# Altium schematic sheet Sheet2.SchDoc: Smart Delivery Robot
size A; Date: 27/12/2023; DrawnBy: Abd El-Rhman m. Saad; Engineer: Abd El-Rhman m. Saad; SheetNumber: 2; SheetTotal: 2
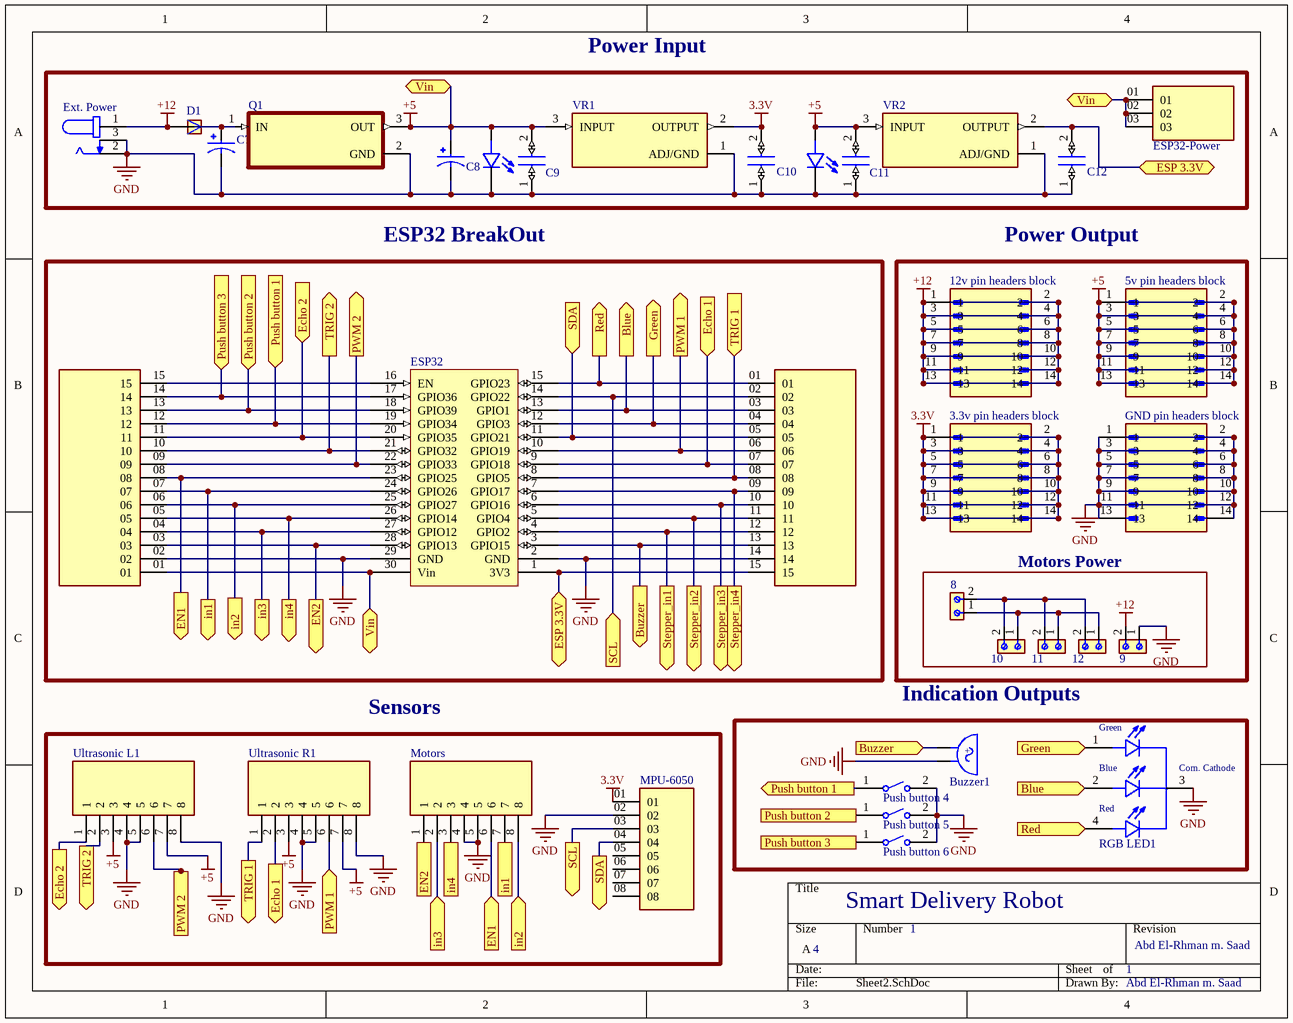
[diagram p0: Sheet2.SchDoc]

## Parts
1  LED 5mm  [LED 5mm]  (value not drawn)
2  LED 5mm  [LED 5mm]  (value not drawn)
3.3v_pin_headers_block  3.3v pin headers block  [AMPHENOL_52601-S14-4LF]  (value not drawn)
5v_pin_headers_block  5v pin headers block  [AMPHENOL_52601-S14-4LF]  (value not drawn)
8  From Buck  [691213510002]  (value not drawn)
9  From Buck  [691213510002]  (value not drawn)
10  From Buck  [691213510002]  (value not drawn)
11  From Buck  [691213510002]  (value not drawn)
12  From Buck  [691213510002]  (value not drawn)
12v_pin_headers_block  12v pin headers block  [AMPHENOL_52601-S14-4LF]  (value not drawn)
Buzzer1  Buzzer  [Buzzer 5V]  (value not drawn)
C7  CAP  33UF 50V RADIAL  [CAP  33UF 50V RADIAL]  (value not drawn)
C8  CAP  33UF 50V RADIAL  [CAP  33UF 50V RADIAL]  (value not drawn)
C9  Ceramic Capacitor 100nF  [C320C]  (value not drawn)
C10  Ceramic Capacitor 100nF  [C320C]  (value not drawn)
C11  Ceramic Capacitor 100nF  [C320C]  (value not drawn)
C12  Ceramic Capacitor 100nF  [C320C]  (value not drawn)
D1  RL207  [DIOAD1300W80L670D310]  (value not drawn)
ESP32  ESP32DEVKITV1  [ESP32DEVKITV1]  (value not drawn)
ESP32-Power  TS-103-T-A-1  [SAMTEC_TS-103-T-A-1]  (value not drawn)
Ext._Power  DC Power Jack Female Socket  [DC Power Jack Female Socket]  (value not drawn)
GND_pin_headers_block  GND pin headers block  [AMPHENOL_52601-S14-4LF]  (value not drawn)
J1  TS-115-T-A-1  [SAMTEC_TS-115-T-A-1]  (value not drawn)
J2  TS-115-T-A-1  [SAMTEC_TS-115-T-A-1]  (value not drawn)
Motors  Pin header female block 8 pin  [Pin header female block 8 pin]  (value not drawn)
MPU-6050  MPU-6050  [MPU-6050]  (value not drawn)
Push_button_4  FSM8JRT  [TE_FSM8JRT]  (value not drawn)
Push_button_5  FSM8JRT  [TE_FSM8JRT]  (value not drawn)
Push_button_6  FSM8JRT  [TE_FSM8JRT]  (value not drawn)
Q1  LM7805CT  [TO254P1054X470X1955-3]  (value not drawn)
RGB_LED1  common cathode  [LED RGB 5mm]  (value not drawn)
Ultrasonic_L1  Pin header female block 8 pin  [Pin header female block 8 pin]  (value not drawn)
Ultrasonic_R1  Pin header female block 8 pin  [Pin header female block 8 pin]  (value not drawn)
VR1  LM1117T-3.3  [TO254P1054X470X1955-3]  (value not drawn)
VR2  LM1117T-3.3  [TO254P1054X470X1955-3]  (value not drawn)

## Blocks framed on the sheet
Power Input: 1 2 C7-C12 D1 ESP32-Power Ext._Power Q1 VR1 VR2
ESP32 BreakOut: ESP32 J1 J2
Power Output: 3.3v_pin_headers_block 5v_pin_headers_block 12v_pin_headers_block GND_pin_headers_block
Motors Power: 8-12
Indication Outputs: Buzzer1 Push_button_4-Push_button_6 RGB_LED1
Sensors: Motors MPU-6050 Ultrasonic_L1 Ultrasonic_R1

## Ports
Blue (in, see Sheet1[2B], Sheet1[4B], Sheet2[2B]), Blue (out, see Sheet1[2B], Sheet1[4B], Sheet2[4D]), Buzzer (in, see Sheet1[2C], Sheet1[4A], Sheet2[2C]), Buzzer (out, see Sheet1[2C], Sheet1[4A], Sheet2[3C]), Echo 1 (in, see Sheet1[3B], Sheet1[4B], Sheet2[1D]), Echo 1 (out, see Sheet1[3B], Sheet1[4B], Sheet2[3B]), Echo 2 (in, see Sheet1[1B], Sheet1[3B], Sheet2[1D]), Echo 2 (out, see Sheet1[1B], Sheet1[3B], Sheet2[1B]), EN1 (in, see Sheet1[1C], Sheet1[4C], Sheet2[1C]), EN1 (out, see Sheet1[1C], Sheet1[4C], Sheet2[2D]), EN2 (in, see Sheet1[2C], Sheet1[4C], Sheet2[1C]), EN2 (out, see Sheet1[2C], Sheet1[4C], Sheet2[2D]), ESP 3.3V (bidir, see Sheet1[2C], Sheet1[3A], Sheet2[2C]), ESP 3.3V (bidir, see Sheet1[2C], Sheet1[3A], Sheet2[4A]), Green (in, see Sheet1[3B], Sheet1[4B], Sheet2[3B]), Green (out, see Sheet1[3B], Sheet1[4B], Sheet2[4C]), in1 (in, see Sheet1[1C], Sheet1[4C], Sheet2[1C]), in1 (out, see Sheet1[1C], Sheet1[4C], Sheet2[2D]), in2 (in, see Sheet1[1C], Sheet1[4C], Sheet2[1C]), in2 (out, see Sheet1[1C], Sheet1[4C], Sheet2[2D]), in3 (in, see Sheet1[1C], Sheet1[4C], Sheet2[1C]), in3 (out, see Sheet1[1C], Sheet1[4C], Sheet2[2D]), in4 (in, see Sheet1[1C], Sheet1[4C], Sheet2[1C]), in4 (out, see Sheet1[1C], Sheet1[4C], Sheet2[2D]), Push button 1 (in, see Sheet1[1B], Sheet1[4C], Sheet2[3D]), Push button 1 (out, see Sheet1[1B], Sheet1[4C], Sheet2[1B]), Push button 2 (in, see Sheet1[1B], Sheet1[4D], Sheet2[3D]), Push button 2 (out, see Sheet1[1B], Sheet1[4D], Sheet2[1B]), Push button 3 (in, see Sheet1[1B], Sheet1[4D], Sheet2[3D]), Push button 3 (out, see Sheet1[1B], Sheet1[4D], Sheet2[1B]), PWM 1 (in, see Sheet1[3B], Sheet1[4B], Sheet2[3B]), PWM 1 (out, see Sheet1[3B], Sheet1[4B], Sheet2[2D]), PWM 2 (in, see Sheet1[2B], Sheet1[4B], Sheet2[2B]), PWM 2 (out, see Sheet1[2B], Sheet1[4B], Sheet2[1D]), Red (in, see Sheet1[2B], Sheet1[4B], Sheet2[2B]), Red (out, see Sheet1[2B], Sheet1[4B], Sheet2[4D]), SCL (in, see Sheet1[2C], Sheet1[3C], Sheet2[2D]), SCL (out, see Sheet1[2C], Sheet1[3C], Sheet2[2C]), SDA (in, see Sheet1[2B], Sheet1[4C], Sheet2[2D]), SDA (out, see Sheet1[2B], Sheet1[4C], Sheet2[2B]), Stepper_in1 (out, see Sheet1[2C]), Stepper_in2 (out, see Sheet1[3C]), Stepper_in3 (out, see Sheet1[3C]), Stepper_in4 (out, see Sheet1[3C]), TRIG 1 (in, see Sheet1[3B], Sheet1[4B], Sheet2[1D]), TRIG 1 (out, see Sheet1[3B], Sheet1[4B], Sheet2[3B]), TRIG 2 (out, see Sheet1[1B], Sheet1[3B], Sheet2[1D]), TRIG 2 (out, see Sheet1[1B], Sheet1[3B], Sheet2[2B]), Vin (bidir, see Sheet1[2A], Sheet1[2C], Sheet2[2A], Sheet2[2C]), Vin (bidir, see Sheet1[2A], Sheet1[2C], Sheet2[2A], Sheet2[4A]), Vin (bidir, see Sheet1[2A], Sheet1[2C], Sheet2[2C], Sheet2[4A])

## Nets
3.3V: 3.3v_pin_headers_block.1 3.3v_pin_headers_block.2 3.3v_pin_headers_block.3 3.3v_pin_headers_block.4 3.3v_pin_headers_block.5 3.3v_pin_headers_block.6 3.3v_pin_headers_block.7 3.3v_pin_headers_block.8 3.3v_pin_headers_block.9 3.3v_pin_headers_block.10 3.3v_pin_headers_block.11 3.3v_pin_headers_block.12 3.3v_pin_headers_block.13 3.3v_pin_headers_block.14 C10.2 MPU-6050.01 VR1.2(OUTPUT)
+5: 1.A 2.A 5v_pin_headers_block.1 5v_pin_headers_block.2 5v_pin_headers_block.3 5v_pin_headers_block.4 5v_pin_headers_block.5 5v_pin_headers_block.6 5v_pin_headers_block.7 5v_pin_headers_block.8 5v_pin_headers_block.9 5v_pin_headers_block.10 5v_pin_headers_block.11 5v_pin_headers_block.12 5v_pin_headers_block.13 5v_pin_headers_block.14 C8.P C9.2 C11.2 ESP32.30(Vin) ESP32-Power.01 ESP32-Power.02 ESP32-Power.03 J2.01 Q1.3(OUT) Ultrasonic_L1.3 Ultrasonic_L1.7 Ultrasonic_R1.3 Ultrasonic_R1.7 VR1.3(INPUT) VR2.3(INPUT) ; port Vin
+12: 9.2 12v_pin_headers_block.1 12v_pin_headers_block.2 12v_pin_headers_block.3 12v_pin_headers_block.4 12v_pin_headers_block.5 12v_pin_headers_block.6 12v_pin_headers_block.7 12v_pin_headers_block.8 12v_pin_headers_block.9 12v_pin_headers_block.10 12v_pin_headers_block.11 12v_pin_headers_block.12 12v_pin_headers_block.13 12v_pin_headers_block.14 D1.A Ext._Power.1
GND: 1.C 2.C 9.1 Buzzer1.NEG C7.N C8.N C9.1 C10.1 C11.1 C12.1 ESP32.2(GND) ESP32.29(GND) Ext._Power.2 Ext._Power.3 GND_pin_headers_block.1 GND_pin_headers_block.2 GND_pin_headers_block.3 GND_pin_headers_block.4 GND_pin_headers_block.5 GND_pin_headers_block.6 GND_pin_headers_block.7 GND_pin_headers_block.8 GND_pin_headers_block.9 GND_pin_headers_block.10 GND_pin_headers_block.11 GND_pin_headers_block.12 GND_pin_headers_block.13 GND_pin_headers_block.14 J1.14 J2.02 Motors.4 Motors.5 MPU-6050.02 Push_button_4.2 Push_button_5.2 Push_button_6.2 Q1.2(GND) RGB_LED1.3(Com._Cathode) Ultrasonic_L1.4 Ultrasonic_L1.5 Ultrasonic_L1.8 Ultrasonic_R1.4 Ultrasonic_R1.5 Ultrasonic_R1.8 VR1.1(ADJ/GND) VR2.1(ADJ/GND)
Blue: ESP32.13(GPIO1) J1.03 RGB_LED1.2(BLUE) ; port Blue
Buzzer: Buzzer1.POS ESP32.3(GPIO15) J1.13 ; port Buzzer
Echo 1: ESP32.9(GPIO18) J1.07 Ultrasonic_R1.2 ; port Echo 1
Echo 2: ESP32.20(GPIO35) J2.11 Ultrasonic_L1.1 ; port Echo 2
EN1: ESP32.23(GPIO25) J2.08 Motors.6 ; port EN1
EN2: ESP32.28(GPIO13) J2.03 Motors.1 ; port EN2
ESP 3.3V: C12.2 ESP32.1(3V3) J1.15 VR2.2(OUTPUT) ; port ESP 3.3V
Green: ESP32.12(GPIO3) J1.04 RGB_LED1.1(Green) ; port Green
in1: ESP32.24(GPIO26) J2.07 Motors.7 ; port in1
in2: ESP32.25(GPIO27) J2.06 Motors.8 ; port in2
in3: ESP32.27(GPIO12) J2.04 Motors.2 ; port in3
in4: ESP32.26(GPIO14) J2.05 Motors.3 ; port in4
Push button 1: ESP32.19(GPIO34) J2.12 Push_button_4.1 ; port Push button 1
Push button 2: ESP32.18(GPIO39) J2.13 Push_button_5.1 ; port Push button 2
Push button 3: ESP32.17(GPIO36) J2.14 Push_button_6.1 ; port Push button 3
PWM 1: ESP32.10(GPIO19) J1.06 Ultrasonic_R1.6 ; port PWM 1
PWM 2: ESP32.22(GPIO33) J2.09 Ultrasonic_L1.6 ; port PWM 2
Red: ESP32.15(GPIO23) J1.01 RGB_LED1.4(Red) ; port Red
SCL: ESP32.14(GPIO22) J1.02 MPU-6050.03 ; port SCL
SDA: ESP32.11(GPIO21) J1.05 MPU-6050.04 ; port SDA
Stepper_in1: ESP32.4(GPIO2) J1.12 ; port Stepper_in1
Stepper_in2: ESP32.5(GPIO4) J1.11 ; port Stepper_in2
Stepper_in3: ESP32.6(GPIO16) J1.10 ; port Stepper_in3
Stepper_in4: ESP32.7(GPIO17) J1.09 ; port Stepper_in4
TRIG 1: ESP32.8(GPIO5) J1.08 Ultrasonic_R1.1 ; port TRIG 1
TRIG 2: ESP32.21(GPIO32) J2.10 Ultrasonic_L1.2 ; port TRIG 2
Net8_1: 8.1 10.1 11.1 12.1
Net8_2: 8.2 10.2 11.2 12.2
NetC7_P: C7.P D1.C Q1.1(IN)
NetESP32_16: ESP32.16(EN) J2.15

Not connected (* = marked no-connect by the designer): MPU-6050 05 06 07 08

## Notes on the sheet
- 4
- 1
- (in symbol Buzzer 5V) +; -
- (in symbol LED RGB 5mm) Blue

## Library data of the parts
1 2 = LED 5mm: Red 623nm LED Indication - Discrete 1.9V Radial; MF: {'manufacturer': u'Wurth Elektronik'}; MP: 151054RS03000; Package: None; Price: None; Value: *; Availability: Unavailable
3.3v_pin_headers_block 5v_pin_headers_block 12v_pin_headers_block GND_pin_headers_block = 52601-S14-4LF: MF: {'manufacturer': u'Amphenol ICC (FCI)'}; Package: None; Price: None; Value: *; MP: 52601-S14-4LF; Availability: Unavailable
8-12 = Terminal Block: 2 Position Wire to Board Terminal Block Horizontal with Board 0.200 (5.08mm) Through Hole; MF: Wurth Electronics; SnapEDA_Link: https://www.snapeda.com/parts/691213510002/Wurth+Electronics/view-part/?ref=snap; Package: None; Value: *; MP: 691213510002; Check_prices: https://www.snapeda.com/parts/691213510002/Wurth+Electronics/view-part/?ref=eda
Buzzer1 = Buzzer 5V: BUZZER 2.3KHZ 4-6VDC; MF: {'manufacturer': u'Soberton Inc.'}; MP: WST-1205S; Package: None; Price: None; Value: *; Availability: Unavailable
C7 C8 = CAP  33UF 50V RADIAL: NHG-A; MF: {'manufacturer': u'Panasonic'}; MP: ECA1HHG330I; Package: None; Price: None; Value: *; Availability: Unavailable
C9-C12 = Ceramic Capacitor 100nF: 0.1ÂµF Â±20% 50V Ceramic Capacitor Z5U Radial; MF: KEMET; MP: C320C104M5U5TA; Package: Radial KEMET; Value: *; SnapEDA_Link: https://www.snapeda.com/parts/C320C104M5U5TA/KEMET/view-part/228184/?ref=snap; Price: None; Availability: Unavailable
D1 = RL207: Semiconductors and Actives, Power Diodes, Discretes (diodes, transistors, thyristors ...), Diodes; MF: {'manufacturer': u'Diodes Inc.'}; Package: None; Price: None; Value: *; MP: RL207; Availability: Unavailable
ESP32-Power = TS-103-T-A-1: MF: {'manufacturer': u'Samtec'}; Package: None; Price: None; Value: *; MP: TS-103-T-A-1; Availability: Unavailable
Ext._Power = DC Power Jack Female Socket: 2.0 mm Center Pin, 2.5 A, Right Angle, Through Hole, Dc Power Jack Connector; MF: {'manufacturer': u'CUI Devices'}; MP: PJ-002A; Package: None; Price: None; Value: *; Availability: Unavailable
J1 J2 = TS-115-T-A-1: MF: {'manufacturer': u'Samtec'}; Package: None; Price: None; Value: *; MP: TS-115-T-A-1; Availability: Unavailable
Motors Ultrasonic_L1 Ultrasonic_R1 = Pin header female block 8 pin: MF: {'manufacturer': u'TE Connectivity'}; MP: 5-534998-4; Package: None; Price: None; Value: *; Availability: Unavailable
Push_button_4-Push_button_6 = FSM8JRT: Tactile Switches PUSHBUTTON SWITCH TACT; MF: {'manufacturer': u'TE Connectivity'}; Package: None; Price: None; Value: *; MP: FSM8JRT; Availability: Unavailable
Q1 = LM7805CT/NOPB: MF: {'manufacturer': u'Texas Instruments'}; Package: None; Price: None; Value: *; MP: LM7805CT/NOPB; Availability: Unavailable
RGB_LED1 = LED RGB 5mm: MF: {'manufacturer': u'Kingbright'}; MP: WP154A4SUREQBFZGC; Package: None; Price: None; Value: *; Availability: Unavailable
VR1 VR2 = LM1117T-3.3/NOPB: MF: {'manufacturer': u'Texas Instruments'}; Package: None; Price: None; Value: *; MP: LM1117T-3.3/NOPB; Availability: Unavailable